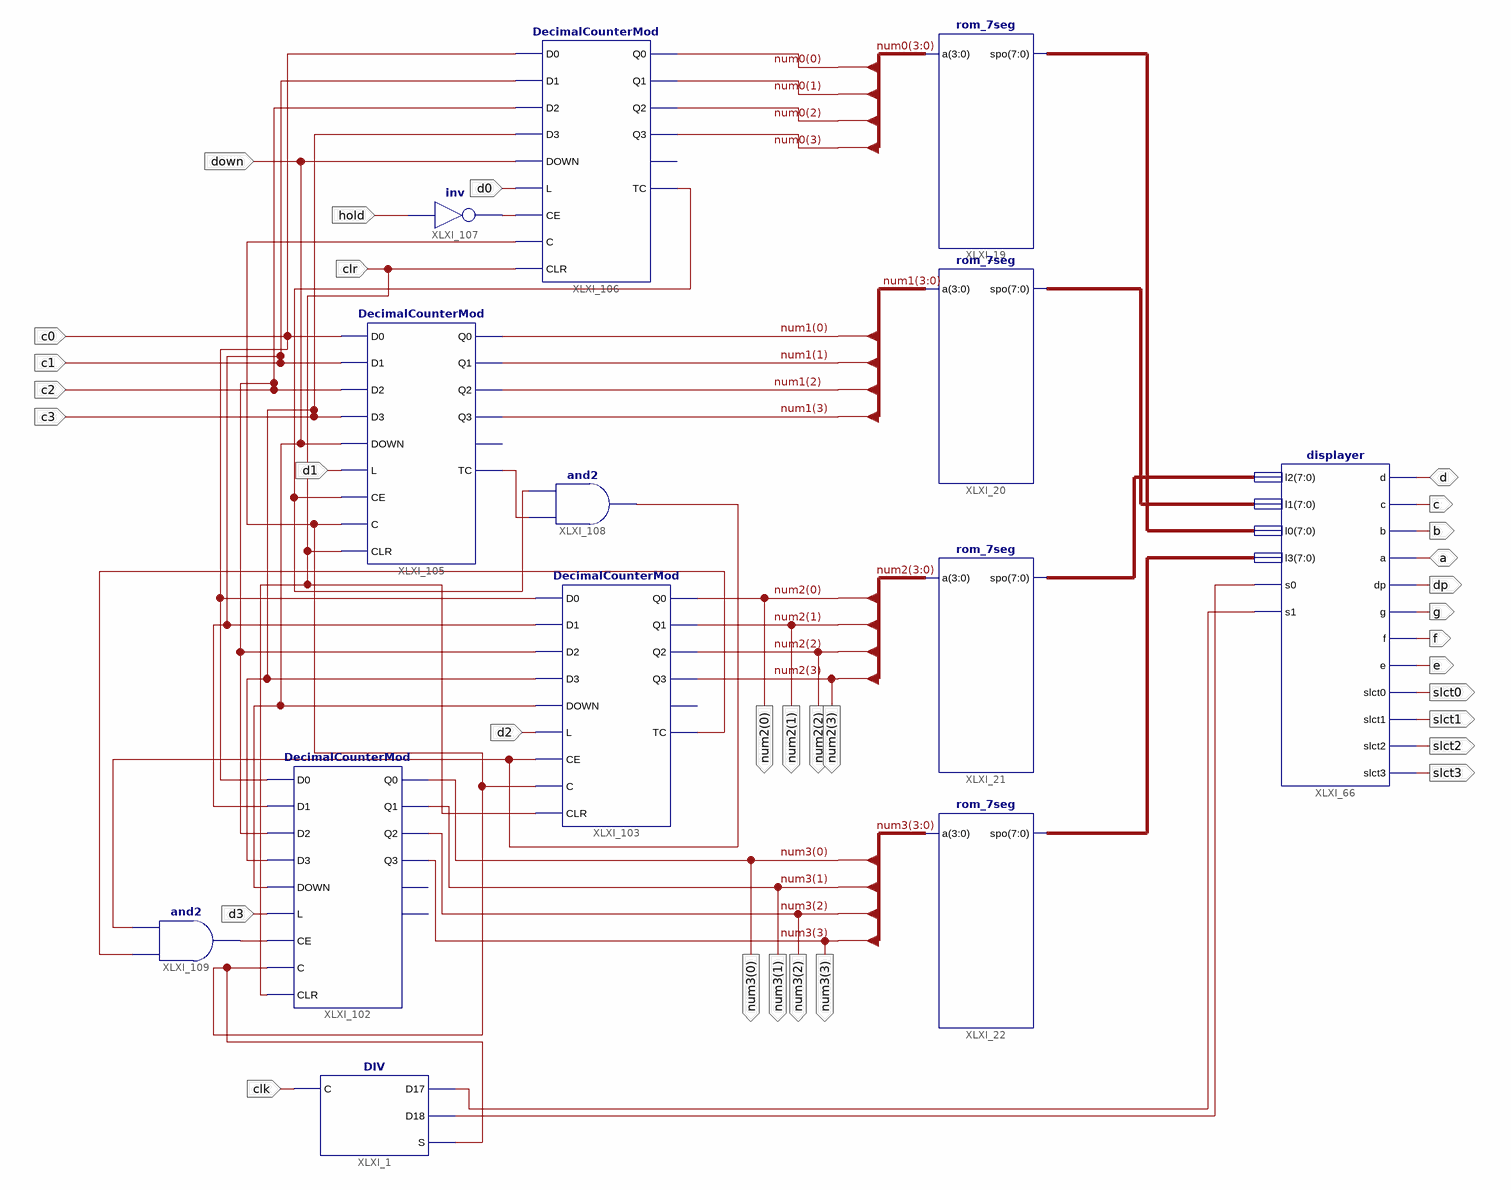
[diagram p0: schematic sheet 1]
// Xilinx ISE schematic main.sch (spartan3e) as structural Verilog: 13 symbols, 32 ports
module main (
  input  clk,
  input  d0,
  input  clr,
  input  hold,
  input  d1,
  input  d2,
  input  d3,
  input  c1,
  input  c2,
  input  c3,
  input  c0,
  input  down,
  inout  d,
  inout  a,
  output [3:0] num2,
  output [3:0] num3,
  output dp,
  output g,
  output f,
  output e,
  output b,
  output slct0,
  output slct1,
  output slct2,
  output slct3,
  output c
);

  wire XLXN_254, XLXN_345, XLXN_387, XLXN_395, XLXN_408, XLXN_420, XLXN_421, XLXN_422, XLXN_423;
  wire [3:0] num0, num1;
  wire [7:0] XLXN_247, XLXN_248, XLXN_249, XLXN_250;

  DIV XLXI_1 (.C(clk), .D17(XLXN_254), .D18(XLXN_345), .S(XLXN_408));
  rom_7seg XLXI_19 (.a(num0), .spo(XLXN_247));
  rom_7seg XLXI_20 (.a(num1), .spo(XLXN_248));
  rom_7seg XLXI_21 (.a(num2), .spo(XLXN_249));
  rom_7seg XLXI_22 (.a(num3), .spo(XLXN_250));
  displayer XLXI_66 (
    .a(a), .b(b), .c(c), .d(d), .dp(dp), .e(e), .f(f), .g(g), .l0(XLXN_247), .l1(XLXN_248), .l2(XLXN_249),
    .l3(XLXN_250), .s0(XLXN_345), .s1(XLXN_254), .slct0(slct0), .slct1(slct1), .slct2(slct2), .slct3(slct3));
  DecimalCounterMod XLXI_102 (
    .C(XLXN_408), .CE(XLXN_421), .CLR(clr), .D0(c0), .D1(c1), .D2(c2), .D3(c3), .DOWN(down), .L(d3),
    .Q0(num3[0]), .Q1(num3[1]), .Q2(num3[2]), .Q3(num3[3]));  // open: CEO, TC
  DecimalCounterMod XLXI_103 (
    .C(XLXN_408), .CE(XLXN_422), .CLR(clr), .D0(c0), .D1(c1), .D2(c2), .D3(c3), .DOWN(down), .L(d2),
    .Q0(num2[0]), .Q1(num2[1]), .Q2(num2[2]), .Q3(num2[3]), .TC(XLXN_423));  // open: CEO
  DecimalCounterMod XLXI_105 (
    .C(XLXN_408), .CE(XLXN_387), .CLR(clr), .D0(c0), .D1(c1), .D2(c2), .D3(c3), .DOWN(down), .L(d1),
    .Q0(num1[0]), .Q1(num1[1]), .Q2(num1[2]), .Q3(num1[3]), .TC(XLXN_420));  // open: CEO
  DecimalCounterMod XLXI_106 (
    .C(XLXN_408), .CE(XLXN_395), .CLR(clr), .D0(c0), .D1(c1), .D2(c2), .D3(c3), .DOWN(down), .L(d0),
    .Q0(num0[0]), .Q1(num0[1]), .Q2(num0[2]), .Q3(num0[3]), .TC(XLXN_387));  // open: CEO
  not XLXI_107 (XLXN_395, hold);
  and XLXI_108 (XLXN_422, XLXN_420, XLXN_387);
  and XLXI_109 (XLXN_421, XLXN_423, XLXN_422);
endmodule
